# Altium project AT-kdFCU.PrjPcb
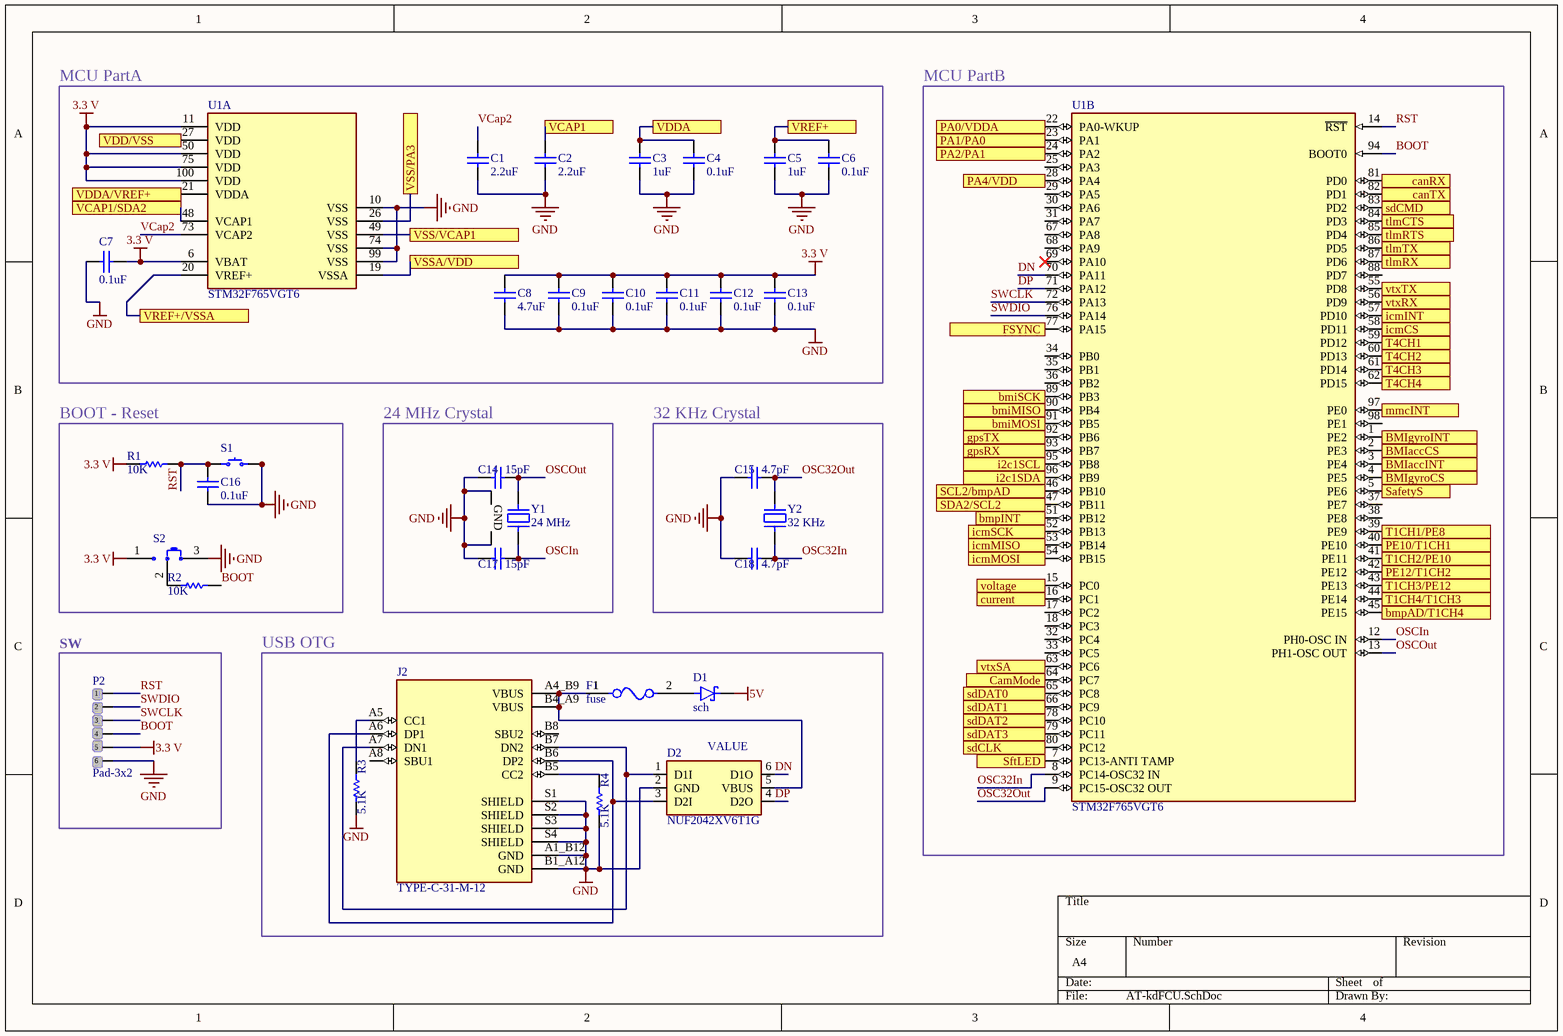
[diagram p0: AT-kdFCU.SchDoc]
3 sheets, 137 parts. Net scope: flat (ports and power ports of the same name join across sheets).
Board file: AT-kdFCU.PcbDoc
Sheets:
  AT-kdFCU.SchDoc
  AT-kdSENS.SchDoc
  AT-kdCONN.SchDoc

## Sheet AT-kdFCU.SchDoc
size A4; SheetNumber: 1; SheetTotal: 3

### Parts
C1  2.2uF  [Capacitor-0603]
C2  2.2uF  [Capacitor-0603]
C3  1uF  [Capacitor-0603]
C4  0.1uF  [Capacitor-0603]
C5  1uF  [Capacitor-0603]
C6  0.1uF  [Capacitor-0603]
C7  0.1uF  [Capacitor-0603]
C8  4.7uF  [Capacitor-0603]
C9  0.1uF  [Capacitor-0603]
C10  0.1uF  [Capacitor-0603]
C11  0.1uF  [Capacitor-0603]
C12  0.1uF  [Capacitor-0603]
C13  0.1uF  [Capacitor-0603]
C14  15pF  [Capacitor-0603]
C15  4.7pF  [Capacitor-0603]
C16  0.1uF  [Capacitor-0603]
C17  15pF  [Capacitor-0603]
C18  4.7pF  [Capacitor-0603]
D1  sch  [SODFL3619X98N]
D2  NUF2042XV6T1G  [SOT-563]
F1  fuse  [FP-MF-NSMF012-2-MFG]
J2  TYPE-C-31-M-12  [HRO_TYPE-C-31-M-12]
P2  Pad-3x2  [Pad-3x2]
R1  10K  [Resistor-0603]
R2  10K  [Resistor-0603]
R3  5.1K  [Resistor-0603]
R4  5.1K  [Resistor-0603]
S1  PTS810 SJM 250 SMTR LFS  [button]  (value not drawn)
S2  slideSwitch  [switch]  (value not drawn)
U1  STM32F765VGT6  [FP-LQFP100-1L-IPC_B]  (parts A,B of 2)
Y1  24 MHz  [XTAL_TSX-3225_25.0000MF10P-C3]
Y2  32 KHz  [XTAL_ABS07-32.768KHZ-7-T]

### Blocks framed on the sheet
MCU PartA: C1-C13 U1
MCU PartB: U1
BOOT - Reset: C16 R1 R2 S1 S2
24 MHz Crystal: C14 C17 Y1
32 KHz Crystal: C15 C18 Y2
SW: P2
USB OTG: D1 D2 F1 J2 R3 R4

### Ports
BMIaccCS (see AT-kdSENS[1A]), BMIaccINT (see AT-kdSENS[1A]), BMIgyroCS (see AT-kdSENS[1A]), BMIgyroINT (see AT-kdSENS[1A]), bmiMISO (see AT-kdSENS[2B]), bmiMOSI (see AT-kdSENS[1A]), bmiSCK (see AT-kdSENS[1A]), bmpAD/T1CH4 (see AT-kdCONN[2D]), bmpINT (see AT-kdSENS[4A]), CamMode (see AT-kdCONN[2C]), canRX (see AT-kdSENS[1C]), canTX (see AT-kdSENS[1B]), current (see AT-kdCONN[3A]), FSYNC (see AT-kdSENS[1A], AT-kdSENS[2A]), gpsRX (see AT-kdCONN[3C]), gpsTX (see AT-kdCONN[3C]), i2c1SCL (see AT-kdSENS[2C]), i2c1SDA (see AT-kdSENS[2D]), icmCS (see AT-kdSENS[2A]), icmINT (see AT-kdSENS[3A]), icmMISO (see AT-kdSENS[2A]), icmMOSI (see AT-kdSENS[2A]), icmSCK (see AT-kdSENS[2A]), mmcINT (see AT-kdSENS[3C]), PA0/VDDA (see AT-kdCONN[2C]), PA1/PA0 (see AT-kdCONN[2C]), PA2/PA1 (see AT-kdCONN[2C]), PA4/VDD (see AT-kdCONN[2C]), PE10/T1CH1 (see AT-kdCONN[2C]), PE12/T1CH2 (see AT-kdCONN[2D]), SafetyS (see AT-kdSENS[4B]), SCL2/bmpAD (see AT-kdCONN[2D]), SDA2/SCL2 (see AT-kdCONN[2D]), sdCLK (see AT-kdSENS[1D]), sdCMD (see AT-kdSENS[1D]), sdDAT0 (see AT-kdSENS[1D]), sdDAT1 (see AT-kdSENS[1D]), sdDAT2 (see AT-kdSENS[1D]), sdDAT3 (see AT-kdSENS[1D]), SftLED (see AT-kdSENS[4C]), T1CH1/PE8 (see AT-kdCONN[2C]), T1CH2/PE10 (see AT-kdCONN[2C]), T1CH3/PE12 (see AT-kdCONN[2D]), T1CH4/T1CH3 (see AT-kdCONN[2D]), T4CH1 (see AT-kdCONN[1A]), T4CH2 (see AT-kdCONN[1A]), T4CH3 (see AT-kdCONN[1A]), T4CH4 (see AT-kdCONN[1A]), tlmCTS (see AT-kdCONN[3C]), tlmRTS (see AT-kdCONN[3C]), tlmRX (see AT-kdCONN[3C]), tlmTX (see AT-kdCONN[3C]), VCAP1 (see AT-kdCONN[1D]), VCAP1/SDA2 (see AT-kdCONN[2D]), VDD/VSS (see AT-kdCONN[2C]), VDDA (see AT-kdCONN[1C]), VDDA/VREF+ (see AT-kdCONN[2B]), voltage (see AT-kdCONN[3A]), VREF+ (see AT-kdCONN[1C]), VREF+/VSSA (see AT-kdCONN[2B]), VSS/PA3 (see AT-kdCONN[2C]), VSS/VCAP1 (see AT-kdCONN[2D]), VSSA/VDD (see AT-kdCONN[2B]), vtxRX (see AT-kdCONN[4C]), vtxSA (see AT-kdCONN[4C]), vtxTX (see AT-kdCONN[4C])

### Nets
3.3 V: C7.2 C8.2 C9.2 C10.2 C11.2 C12.2 C13.2 P2.5 R1.1 S2.1 U1.6(VBAT) U1.11(VDD) U1.50(VDD) U1.75(VDD) U1.100(VDD)
5V: D1.K
GND: C1.1 C2.1 C3.1 C4.1 C5.1 C6.1 C7.1 C8.1 C9.1 C10.1 C11.1 C12.1 C13.1 C14.2 C15.2 C16.1 C17.2 C18.2 D2.2(GND) J2.A1_B12(GND) J2.B1_A12(GND) J2.S1(SHIELD) J2.S2(SHIELD) J2.S3(SHIELD) J2.S4(SHIELD) P2.6 R3.1 R4.1 S1.3 S1.4 S2.3 U1.10(VSS) U1.74(VSS) U1.99(VSS) Y1.2(GND) Y1.4(GND)
BOOT: P2.4 R2.2 U1.94(BOOT0)
DN: D2.6(D1O) U1.70(PA11)
DP: D2.4(D2O) U1.71(PA12)
OSC32In: C18.1 U1.8(PC14-OSC32_IN) Y2.1
OSC32Out: C15.1 U1.9(PC15-OSC32_OUT) Y2.2
OSCIn: C17.1 U1.12(PH0-OSC_IN) Y1.3
OSCOut: C14.1 U1.13(PH1-OSC_OUT) Y1.1
RST: C16.2 P2.1 R1.2 S1.1 S1.2 U1.14(~{RST})
SWCLK: P2.3 U1.72(PA13)
SWDIO: P2.2 U1.76(PA14)
VCap2: C1.2 U1.73(VCAP2)
NetC2_2: C2.2 ; port VCAP1
NetC3_2: C3.2 C4.2 ; port VDDA
NetC5_2: C5.2 C6.2 ; port VREF+
NetC31_1: U1.5(PE6) ; port SafetyS
NetC35_1: U1.15(PC0) ; port voltage
NetC36_1: U1.16(PC1) ; port current
NetD1_A: D1.A F1.2
NetD2_1: D2.1(D1I) J2.A7(DN1) J2.B7(DN2)
NetD2_3: D2.3(D2I) J2.A6(DP1) J2.B6(DP2)
NetD2_5: D2.5(VBUS) F1.1 J2.A4_B9(VBUS) J2.B4_A9(VBUS)
NetDS1_2: U1.7(PC13-ANTI_TAMP) ; port SftLED
NetJ2_A5: J2.A5(CC1) R3.2
NetJ2_B5: J2.B5(CC2) R4.2
NetJ3_1: U1.78(PC10) ; port sdDAT2
NetJ3_2: U1.79(PC11) ; port sdDAT3
NetJ3_3: U1.83(PD2) ; port sdCMD
NetJ3_7: U1.65(PC8) ; port sdDAT0
NetJ3_8: U1.66(PC9) ; port sdDAT1
NetJ6_3: U1.64(PC7) ; port CamMode
NetJ7_2: U1.24(PA2) ; port PA2/PA1
NetJ9_2: U1.86(PD5) ; port tlmTX
NetJ9_3: U1.87(PD6) ; port tlmRX
NetJ9_4: U1.84(PD3) ; port tlmCTS
NetJ9_5: U1.85(PD4) ; port tlmRTS
NetJ10_2: U1.92(PB6) ; port gpsTX
NetJ10_3: U1.93(PB7) ; port gpsRX
NetJ10_4: U1.95(PB8) ; port i2c1SCL
NetJ10_5: U1.96(PB9) ; port i2c1SDA
NetJ11_2: U1.56(PD9) ; port vtxRX
NetJ11_3: U1.55(PD8) ; port vtxTX
NetJ11_4: U1.63(PC6) ; port vtxSA
NetR2_1: R2.1 S2.2(COM)
NetR7_2: U1.90(PB4) ; port bmiMISO
NetR13_1: U1.82(PD1) ; port canTX
NetR15_1: U1.81(PD0) ; port canRX
NetR24_2: U1.80(PC12) ; port sdCLK
NetR29_2: U1.59(PD12) ; port T4CH1
NetR32_2: U1.60(PD13) ; port T4CH2
NetR33_2: U1.61(PD14) ; port T4CH3
NetR34_2: U1.62(PD15) ; port T4CH4
NetR39_2: U1.19(VSSA) ; port VSSA/VDD
NetR41_2: U1.20(VREF+) ; port VREF+/VSSA
NetR44_2: U1.21(VDDA) ; port VDDA/VREF+
NetR46_2: U1.22(PA0-WKUP) ; port PA0/VDDA
NetR48_2: U1.23(PA1) ; port PA1/PA0
NetR50_2: U1.26(VSS) ; port VSS/PA3
NetR51_2: U1.27(VDD) ; port VDD/VSS
NetR53_2: U1.28(PA4) ; port PA4/VDD
NetR55_2: U1.39(PE9) ; port T1CH1/PE8
NetR57_2: U1.40(PE10) ; port PE10/T1CH1
NetR58_2: U1.41(PE11) ; port T1CH2/PE10
NetR59_2: U1.42(PE12) ; port PE12/T1CH2
NetR60_2: U1.43(PE13) ; port T1CH3/PE12
NetR61_2: U1.44(PE14) ; port T1CH4/T1CH3
NetR63_2: U1.45(PE15) ; port bmpAD/T1CH4
NetR65_2: U1.46(PB10) ; port SCL2/bmpAD
NetR67_2: U1.47(PB11) ; port SDA2/SCL2
NetR69_2: U1.48(VCAP1) ; port VCAP1/SDA2
NetR71_2: U1.49(VSS) ; port VSS/VCAP1
NetU1_1: U1.1(PE2) ; port BMIgyroINT
NetU1_2: U1.2(PE3) ; port BMIaccCS
NetU1_3: U1.3(PE4) ; port BMIaccINT
NetU1_4: U1.4(PE5) ; port BMIgyroCS
NetU1_51: U1.51(PB12) ; port bmpINT
NetU1_52: U1.52(PB13) ; port icmSCK
NetU1_53: U1.53(PB14) ; port icmMISO
NetU1_54: U1.54(PB15) ; port icmMOSI
NetU1_57: U1.57(PD10) ; port icmINT
NetU1_58: U1.58(PD11) ; port icmCS
NetU1_77: U1.77(PA15) ; port FSYNC
NetU1_89: U1.89(PB3) ; port bmiSCK
NetU1_91: U1.91(PB5) ; port bmiMOSI
NetU1_97: U1.97(PE0) ; port mmcINT

Not connected (* = marked no-connect by the designer): J2 A8(SBU1) B8(SBU2); U1 17(PC2) 18(PC3) 25(PA3) 29(PA5) 30(PA6) 31(PA7) 32(PC4) 33(PC5) 34(PB0) 35(PB1) 36(PB2) 37(PE7) 38(PE8) 67(PA8) 68(PA9) 69(PA10)* 88(PD7) 98(PE1)

### Notes on the sheet
- (in symbol NUF2042XV6T1G) VALUE

### Library data of the parts
C1-C18 = 0603-Cap
D1 = MBR230LSFT1G: DIODE SCHOTTKY 30V 2A SOD123 MBR230LSTR; MF: ON Semiconductor; SnapEDA_Link: https://www.snapeda.com/parts/MBR230LSFT1G/Onsemi/view-part/?ref=snap; Package: SOD-123FL-2 ON Semiconductor; Value: *; MP: MBR230LSFT1G; Check_prices: https://www.snapeda.com/parts/MBR230LSFT1G/Onsemi/view-part/?ref=eda
D2 = NUF2042XV6T1G: RC (Pi) EMI Filter 2nd Order Low Pass 2 Channel R = 22Ohms, C = 42pF (Total) SOT-563, SOT-666; MF: onsemi; SnapEDA_Link: https://www.snapeda.com/parts/NUF2042XV6T1G/Onsemi/view-part/?ref=snap; Package: SOT-563-6 ON Semiconductor; MP: NUF2042XV6T1G; Check_prices: https://www.snapeda.com/parts/NUF2042XV6T1G/Onsemi/view-part/?ref=eda
F1 = CMP-07400-000025-1: PTC RESET FUSE 30V 120MA 1206; Manufacturer Part Number: MF-NSMF012-2; Manufacturer: Bourns Inc.; Hold Current: 0.12A; Trip Time: 0.2s; Trip Current: 0.29A; Automotive Grade: Grade 3; Resistance: 1.35-8.5Ω; Current Rating: 10A; Value: 1.35-8.5Ω; Category: Fuse; Device Class L2: PTC Resettable Fuses; ComponentLink2URL: https://www.bourns.com/docs/Product-Datasheets/mfnsmf.pdf; Package: MF-NSMF012-2; Automotive: Yes; Temperature Range Low: -40°C; Lead Free: Yes; Voltage Rating: 30V; Digikey Description: PTC RESET FUSE 30V 120MA 1206; Ambient Temperature Range Low: -40°C; Ambient Temperature Range High: +85°C; RoHS: TRUE; Device Class L3: unset; Device Class L1: Circuit Protection; Mouser Description: Resettable Fuses - PPTC 0.12A 30V 1.35ohm; Octopart: https://octopart.com/mf-nsmf012-2-bourns-24569; Temperature Range High: +85°C; ComponentLink2Description: Datasheet; Height: 1.1mm; Temperature: -40°C to +85°C
J2 = TYPE-C-31-M-12: USB Connectors 24 Receptacle 1 8.94*7.3mm RoHS; MF: HRO Electronics Co., Ltd.; Price: None; Value: *; SnapEDA_Link: https://www.snapeda.com/parts/TYPE-C-31-M-12/HRO+Electronics+Co.%252C+Ltd./view-part/?ref=snap; Package: Package; Availability: Not in stock; Check_prices: https://www.snapeda.com/parts/TYPE-C-31-M-12/HRO+Electronics+Co.%252C+Ltd./view-part/?ref=eda; MP: TYPE-C-31-M-12
R1-R4 = 0603-Res
S1 = PTS810 SJM 250 SMTR LFS: SWITCH TACTILE SPST-NO 0.05A 16V; Manufacturer: C&K; Actuator Height off PCB, Vertical: 2.50mm; Actuator Orientation: Top Actuated; Actuator Type: Oval Button; Contact Rating @ Voltage: 0.05A @ 16VDC; Illumination: Non-Illuminated; Operating Force: 160gf; Outline: 4.20mm x 3.20mm; Switch Function: Off-Mom; Part Number: PTS810 SJM 250 SMTR LFS; Circuit: SPST-NO; ComponentLink1Description: Datasheet; ComponentLink1URL: https://dznh3ojzb2azq.cloudfront.net/products/Tactile/PTS810/documents/datasheet.pdf; ComponentLink2Description: DigiKey Link; ComponentLink2URL: http://digikey.com/product-detail/en/c-k/PTS810-SJM-250-SMTR-LFS/CKN10502CT-ND/4176673; LastUpdated: 9/04/2020 10:00:13; Lifecycle Status: Active; Minimum Order: 1; Mounting Type: Surface Mount; Operating Temperature: -40°C ~ 85°C; Packaging: TapeAndReel; Part Status: Active; Price: 0.16; Series: PTS810; Supplier 1: DigiKey; Supplier Part Number 1: CKN10502CT-ND; Termination Style: J Lead
S2 = SS312SAH4-R: SWITCH SLIDE SPDT 0.4VA 28V; Part Number: SS312SAH4-R
U1 = CMP-12105-000145-1: IC MCU 32BIT 1MB FLASH 100LQFP; Peripherals: Brown-out Detect/Reset; Number of I/Os: 82; Interface: I2C; Oscillator Type: Internal; Frequency: 216MHz; Core Architecture: ARM; Memory Size: 1MB; Min Operating Temperature: -40°C; Packaging: Tray; Memory Type: FLASH; Max Operating Temperature: 85°C; Case/Package: LQFP; RoHS Compliant: Yes
Y1 = TSX-3225 24.0000MF15X-AC6: CRYSTAL 24.0000MHZ 9PF SMD; Manufacturer: EPSON; ESR (Equivalent Series Resistance): 40 Ohms; Frequency Stability: ±15ppm; Frequency Tolerance: ±10ppm; Operating Mode: Fundamental; Part Number: TSX-3225 24.0000MF15X-AC6; ComponentLink1Description: Datasheet; ComponentLink1URL: https://support.epson.biz/td/api/doc_check.php?dl=brief_TSX-3225&lang=en; ComponentLink2Description: DigiKey Link; ComponentLink2URL: https://www.digikey.com/en/products/detail/epson/TSX-3225-24-0000MF15X-AC6/5261221; Frequency: 24 MHz; Height - Seated (Max): 0.024" (0.60mm); LastUpdated: 3.06.2024 20:02:15; Lifecycle Status: Active; Load Capacitance: 9pF; Minimum Order: 1; Mounting Type: Surface Mount; Operating Temperature: -40°C ~ 85°C; Package / Case: 4-SMD, No Lead; Packaging: TapeAndReel; PartId: 432; Part Status: Active; Price: 0.20; Series: TSX-3225; Size / Dimension: 0.126" L x 0.098" W (3.20mm x 2.50mm); Supplier 1: DigiKey; Supplier Part Number 1: SER4180CT-ND; Type: MHz Crystal; Value: 24 MHz
Y2 = ABS07-32.768KHZ-7-T: CRYSTAL 32.7680KHZ 7PF SMD; Part Number: ABS07-32.768KHZ-7-T

## Sheet AT-kdSENS.SchDoc
size A4; SheetNumber: 2; SheetTotal: 3
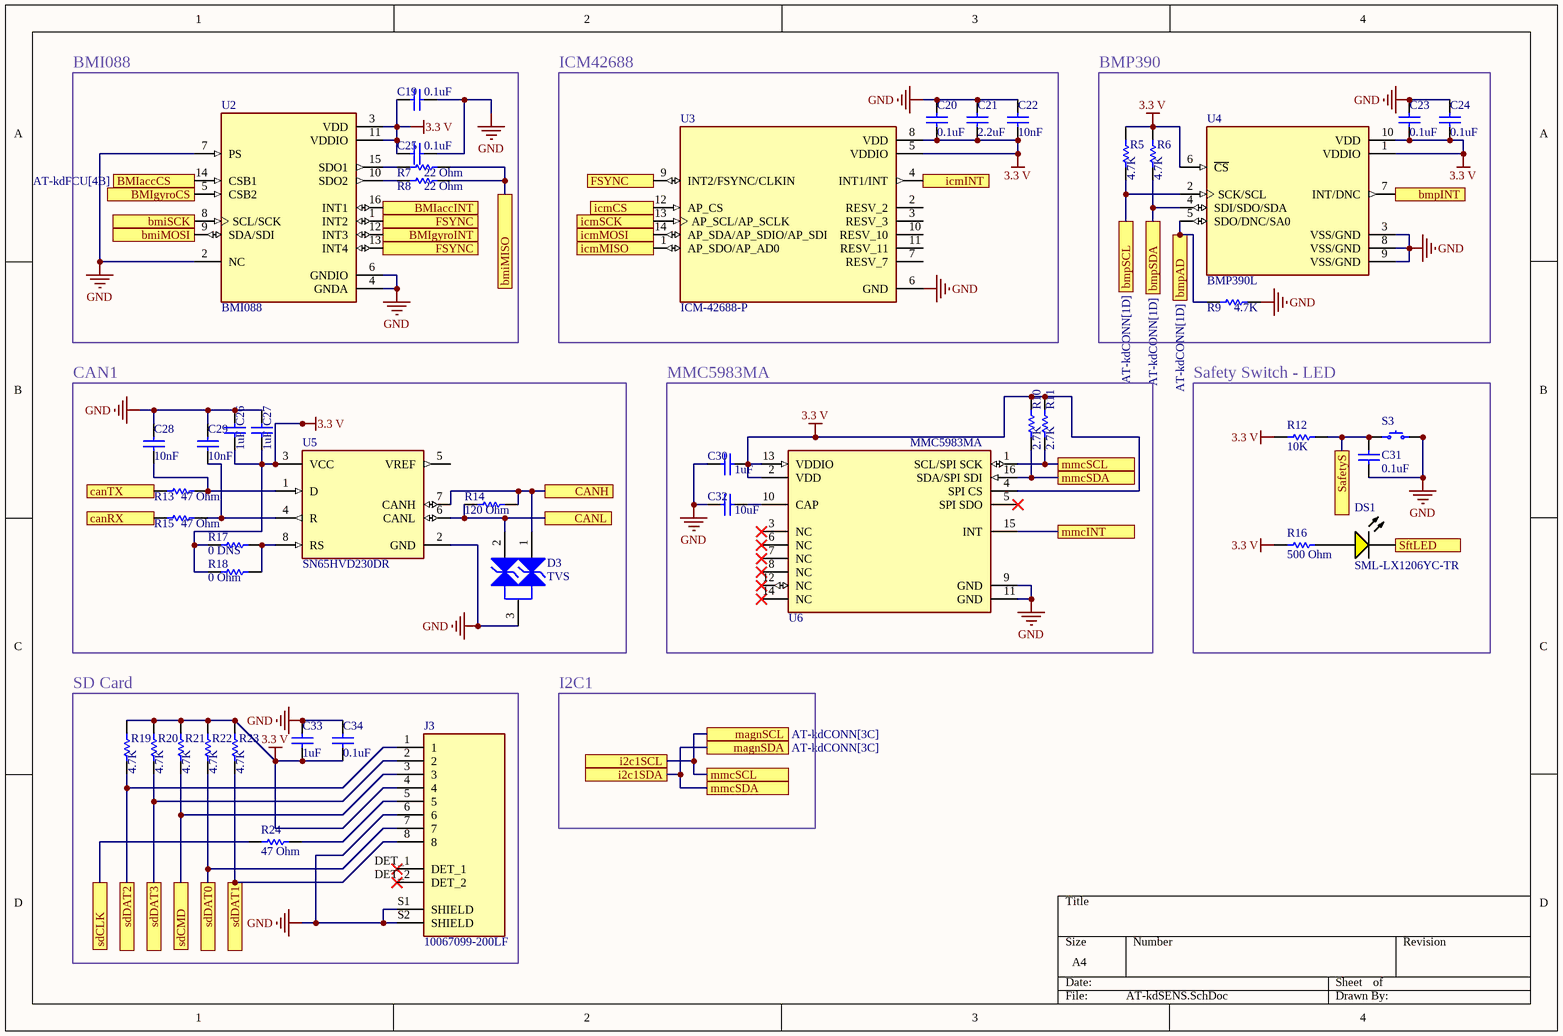
[diagram p1: AT-kdSENS.SchDoc]

### Parts
C19  0.1uF  [Capacitor-0603]
C20  0.1uF  [Capacitor-0603]
C21  2.2uF  [Capacitor-0603]
C22  10nF  [Capacitor-0603]
C23  0.1uF  [Capacitor-0603]
C24  0.1uF  [Capacitor-0603]
C25  0.1uF  [Capacitor-0603]
C26  1uF  [Capacitor-0603]
C27  1uF  [Capacitor-0603]
C28  10nF  [Capacitor-0603]
C29  10nF  [Capacitor-0603]
C30  1uF  [Capacitor-0603]
C31  0.1uF  [Capacitor-0603]
C32  10uF  [Capacitor-0603]
C33  1uF  [Capacitor-0603]
C34  0.1uF  [Capacitor-0603]
D3  TVS  [ONSC-SOT-23-3-318-08_V]
DS1  SML-LX1206YC-TR  [LUMX-SML-LX1206YC-TR_V]
J3  10067099-200LF  [AMPHENOL_10067099-200LF]
R5  4.7K  [Resistor-0603]
R6  4.7K  [Resistor-0603]
R7  22 Ohm  [Resistor-0603]
R8  22 Ohm  [Resistor-0603]
R9  4.7K  [Resistor-0603]
R10  2.7K  [Resistor-0603]
R11  2.7K  [Resistor-0603]
R12  10K  [Resistor-0603]
R13  47 Ohm  [Resistor-0603]
R14  120 Ohm  [Resistor-0603]
R15  47 Ohm  [Resistor-0603]
R16  500 Ohm  [Resistor-0603]
R17  0 DNS  [Resistor-0603]
R18  0 Ohm  [Resistor-0603]
R19  4.7K  [Resistor-0603]
R20  4.7K  [Resistor-0603]
R21  4.7K  [Resistor-0603]
R22  4.7K  [Resistor-0603]
R23  4.7K  [Resistor-0603]
R24  47 Ohm  [Resistor-0603]
S3  PTS810 SJM 250 SMTR LFS  [button]  (value not drawn)
U2  BMI088  [PQFN50P450X300X100-16N]
U3  ICM-42688-P  [PQFN50P300X250X97-14N]
U4  BMP390L  [XDCR_BMP390L]
U5  SN65HVD230DR  [FP-D0008A-IPC_A]
U6  MMC5983MA  [Memsic_0_MFG]

### Blocks framed on the sheet
BMI088: C19 C25 R7 R8 U2
ICM42688: C20-C22 U3
BMP390: C23 C24 R5 R6 R9 U4
CAN1: C26-C29 D3 R13-R15 R17 R18 U5
MMC5983MA: C30 C32 R10 R11 U6
Safety Switch - LED: C31 DS1 R12 R16 S3
SD Card: C33 C34 J3 R19-R24

### Ports
BMIaccCS (see AT-kdFCU[4B]), BMIaccINT (see AT-kdFCU[4B]), BMIgyroCS (see AT-kdFCU[4B]), BMIgyroINT (see AT-kdFCU[4B]), bmiMISO (see AT-kdFCU[3B]), bmiMOSI (see AT-kdFCU[3B]), bmiSCK (see AT-kdFCU[3B]), bmpAD (see AT-kdCONN[1D]), bmpINT (see AT-kdFCU[3C]), bmpSCL (see AT-kdCONN[1D]), bmpSDA (see AT-kdCONN[1D]), CANH (see AT-kdCONN[4C]), CANL (see AT-kdCONN[4C]), canRX (see AT-kdFCU[4A]), canTX (see AT-kdFCU[4A]), FSYNC (see AT-kdFCU[3B], AT-kdSENS[1A]), FSYNC (see AT-kdFCU[3B], AT-kdSENS[1A], AT-kdSENS[2A]), i2c1SCL (see AT-kdFCU[3B]), i2c1SDA (see AT-kdFCU[3B]), icmCS (see AT-kdFCU[4B]), icmINT (see AT-kdFCU[4B]), icmMISO (see AT-kdFCU[3C]), icmMOSI (see AT-kdFCU[3C]), icmSCK (see AT-kdFCU[3C]), magnSCL (see AT-kdCONN[3C]), magnSDA (see AT-kdCONN[3C]), mmcINT (see AT-kdFCU[4B]), mmcSCL (see AT-kdSENS[2D]), mmcSCL (see AT-kdSENS[3B]), mmcSDA (see AT-kdSENS[2D]), mmcSDA (see AT-kdSENS[3B]), SafetyS (see AT-kdFCU[4B]), sdCLK (see AT-kdFCU[3C]), sdCMD (see AT-kdFCU[4A]), sdDAT0 (see AT-kdFCU[3C]), sdDAT1 (see AT-kdFCU[3C]), sdDAT2 (see AT-kdFCU[3C]), sdDAT3 (see AT-kdFCU[3C]), SftLED (see AT-kdFCU[3C])

### Nets
3.3 V: C19.2 C20.2 C21.2 C22.2 C23.2 C24.2 C25.2 C26.1 C27.1 C30.2 C33.2 C34.2 J3.4 R5.2 R6.2 R10.2 R11.2 R12.2 R16.2 R17.1 R18.1 R19.2 R20.2 R21.2 R22.2 R23.2 U2.3(VDD) U2.11(VDDIO) U3.5(VDDIO) U3.8(VDD) U4.1(VDDIO) U4.6(~{CS}) U4.10(VDD) U5.3(VCC) U6.2(VDD) U6.4(SPI_CS) U6.13(VDDIO)
GND: C19.1 C20.1 C21.1 C22.1 C23.1 C24.1 C25.1 C26.2 C27.2 C28.1 C29.1 C30.1 C31.2 C32.1 C33.1 C34.1 D3.3(K) J3.6 J3.S1(SHIELD) J3.S2(SHIELD) R9.2 S3.3 S3.4 U2.2(NC) U2.4(GNDA) U2.6(GNDIO) U2.7(PS) U3.6(GND) U4.3(VSS/GND) U4.8(VSS/GND) U4.9(VSS/GND) U5.2(GND) U6.9(GND) U6.11(GND)
NetC28_2: C28.2 R13.2 U5.1(D)
NetC29_2: C29.2 R15.2 U5.4(R)
NetC31_1: C31.1 R12.1 S3.1 S3.2 ; port SafetyS
NetC32_2: C32.2 U6.10(CAP)
NetD3_1: D3.1(K) R14.2 U5.7(CANH) ; port CANH
NetD3_2: D3.2(K) R14.1 U5.6(CANL) ; port CANL
NetDS1_1: DS1.1(A) R16.1
NetDS1_2: DS1.2(K) ; port SftLED
NetJ3_1: J3.1 R19.1 ; port sdDAT2
NetJ3_2: J3.2 R20.1 ; port sdDAT3
NetJ3_3: J3.3 R21.1 ; port sdCMD
NetJ3_5: J3.5 R24.1
NetJ3_7: J3.7 R22.1 ; port sdDAT0
NetJ3_8: J3.8 R23.1 ; port sdDAT1
NetJ10_4: R11.1 U6.1(SCL/SPI_SCK) ; port mmcSCL, port i2c1SCL, port magnSCL
NetJ10_5: R10.1 U6.16(SDA/SPI_SDI) ; port mmcSDA, port i2c1SDA, port magnSDA
NetR5_1: R5.1 U4.2(SCK/SCL) ; port bmpSCL
NetR6_1: R6.1 U4.4(SDI/SDO/SDA) ; port bmpSDA
NetR7_1: R7.1 U2.15(SDO1)
NetR7_2: R7.2 R8.2 ; port bmiMISO
NetR8_1: R8.1 U2.10(SDO2)
NetR9_1: R9.1 U4.5(SDO/DNC/SA0) ; port bmpAD
NetR13_1: R13.1 ; port canTX
NetR15_1: R15.1 ; port canRX
NetR17_2: R17.2 R18.2 U5.8(RS)
NetR24_2: R24.2 ; port sdCLK
NetU1_1: U2.12(INT3) ; port BMIgyroINT
NetU1_2: U2.14(CSB1) ; port BMIaccCS
NetU1_3: U2.16(INT1) ; port BMIaccINT
NetU1_4: U2.5(CSB2) ; port BMIgyroCS
NetU1_51: U4.7(INT/DNC) ; port bmpINT
NetU1_52: U3.13(AP_SCL/AP_SCLK) ; port icmSCK
NetU1_53: U3.1(AP_SDO/AP_AD0) ; port icmMISO
NetU1_54: U3.14(AP_SDA/AP_SDIO/AP_SDI) ; port icmMOSI
NetU1_57: U3.4(INT1/INT) ; port icmINT
NetU1_58: U3.12(AP_CS) ; port icmCS
NetU1_77: U2.1(INT2) U2.13(INT4) U3.9(INT2/FSYNC/CLKIN) ; port FSYNC
NetU1_89: U2.8(SCL/SCK) ; port bmiSCK
NetU1_91: U2.9(SDA/SDI) ; port bmiMOSI
NetU1_97: U6.15(INT) ; port mmcINT

Not connected (* = marked no-connect by the designer): J3 DET_1* DET_2*; U3 2(RESV_2) 3(RESV_3) 7(RESV_7) 10(RESV_10) 11(RESV_11); U5 5(VREF); U6 3(NC)* 5(SPI_SDO)* 6(NC)* 7(NC)* 8(NC)* 12(NC)* 14(NC)*

### Notes on the sheet
- I2C1

### Library data of the parts
C19-C34 = 0603-Cap
D3 = CMP-1063-00164-1: Dual Line CAN Bus Protector, 3-Pin SOT-23, Pb-Free, Tape and Reel; PartNumber: NUP2105LT1G; Manufacturer: On Semiconductor; IR Max (uA): 0.1; Number of Lines: 2; Direction: Bidirectional; C Max (pF): 30; PPK Max (W): 350; V(BR) Min (V): 26.2; ComponentLink3URL: http://www.onsemi.cn/pub_link/Collateral/318-08.PDF; Mounting Technology: Surface Mount; ComponentLink2Description: Datasheet; ComponentLink1URL: http://www.onsemi.com/; PackageVersion: Rev. AP, 11/2009; DatasheetVersion: Rev. 5; RoHS: Pb-Free; PackageReference: SOT-23-3-318-08; ComponentLink2URL: http://www.onsemi.cn/pub_link/Collateral/NUP2105L-D.PDF; ComponentLink1Description: Manufacturer URL; PackageDescription: 3-Pin Small Outline Transistor, Body 2.92 x 1.3 mm, Pitch 0.95 mm; Packing: Tape and Reel; ComponentLink3Description: Package Specification
DS1 = CMP-2000-07124-1: Yellow LED, Water Clear Len, 585 nm, 2.1 V, -40 to 85 degC, 2-Pin SMD, RoHS, Tape and Reel; Manufacturer: Lumex; Product Training Modules: LEDsBenefitsofCustomLEDandLCDTechnology; Millicandela Rating: 6mcd; Catalog Drawings: SML-LX1206SeriesTopSML-LX1206SeriesSideSML-LX1206SeriesBottomSML-LX1206SeriesFootprint; Wavelength - Peak: 585nm; Other Names: 67-1358-2LU60357TRSMLLX1206YCTR; Lens Style/Size: RectanglewithFlatTop; Current - Test: 20mA; Lens Color: Colorless; Viewing Angle: 160°; Voltage - Forward (Vf) (Typ): 2.1V; Online Catalog: SML-LX1206RectanglewithFlatTop1206PackageLEDs; Mounting Type: SurfaceMount; Package Description: 2-Pin Surface Mount Device, Body 3.2 x 1.5 mm; Datasheet Version: Rev. K, 08/2012; Features: -; Color: Yellow; RoHS Information: RoHSCertofCompliance; Package Reference: SML-LX1206YC-TR; Supplier Device Package: 1206; Standard Package: 3,000; Series: -; Wavelength - Dominant: -; Package / Case: 1206(3216Metric); Mounting Technology: SurfaceMount; Height (Max): 1.10mm; Lens Transparency: Clear; Datasheet URL: http://www.lumex.com/content/files/ProductAttachment/SML-LX1206YC-TR.pdf; Family: LEDIndication-Discrete; Manufacturer URL: http://www.lumexinstruments.com/; Packaging: Tape&Reel(TR); Category: Optoelectronics; Size / Dimension: 3.20mmLx1.60mmW
J3 = 10067099-200LF: MF: {'manufacturer': u'Amphenol ICC (FCI)'}; Package: None; Price: None; Value: *; MP: 10067099-200LF; Availability: Unavailable
R5-R24 = 0603-Res
S3 = PTS810 SJM 250 SMTR LFS: as S1 on sheet AT-kdFCU; Part Number: PTS810 SJM 250 SMTR LFS; Circuit: SPST-NO; ComponentLink1Description: Datasheet; ComponentLink1URL: https://dznh3ojzb2azq.cloudfront.net/products/Tactile/PTS810/documents/datasheet.pdf; ComponentLink2Description: DigiKey Link; ComponentLink2URL: http://digikey.com/product-detail/en/c-k/PTS810-SJM-250-SMTR-LFS/CKN10502CT-ND/4176673; LastUpdated: 9/04/2020 10:00:13; Lifecycle Status: Active; Minimum Order: 1; Mounting Type: Surface Mount; Operating Temperature: -40°C ~ 85°C; Packaging: TapeAndReel; Part Status: Active; Price: 0.16; Series: PTS810; Supplier 1: DigiKey; Supplier Part Number 1: CKN10502CT-ND; Termination Style: J Lead
U2 = BMI088: High-performance 6-axis inertial sensor (accelerometer + gyroscope) <a href="https://pricing.snapeda.com/parts/BMI088/Bosch%20Sensortec/view-part?ref=eda">Check prices</a>; Package: None; MP: BMI088; Value: *; Availability: Unavailable; Price: None
U3 = ICM-42688-P: Accelerometer, Gyroscope, 6 Axis Sensor Output; Package: None; MP: ICM-42688-P; Value: *; Availability: Unavailable; Price: None
U4 = BMP390L: Pressure Sensor 4.35PSI ~ 18.13PSI (30kPa ~ 125kPa) Absolute - - 10-WFLGA; MF: Bosch Sensortec; SnapEDA_Link: https://www.snapeda.com/parts/BMP390L/Bosch+Sensortec/view-part/?ref=snap; Package: None; Value: *; MP: BMP390L; Check_prices: https://www.snapeda.com/parts/BMP390L/Bosch+Sensortec/view-part/?ref=eda
U5 = CMP-0315-00015-3: IC TRANSCEIVER HALF 1/1 8SOIC; Number of Transceivers: 1; Operating Supply Voltage: 3.3V; Number of I/Os: 2; Max Supply Current: 17mA; Max Supply Voltage: 3.6V; Min Supply Voltage: 3V; Data Rate: 1Mbps; Min Operating Temperature: -40°C; Packaging: Tape and Reel; Lead Free: Lead Free; Number of Transmit Buffers: 1; Max Operating Temperature: 85°C; Number of Receive Buffers: 1; Number of Pins: 8; Package Quantity: 1; Radiation Hardening: No; Case/Package: D; REACH SVHC: No SVHC; Weight: 0.002561oz; Termination: SMD/SMT; Contact Plating: Gold; Nominal Supply Current: 17mA; Number of Receivers: 1; Number of Drivers: 1

## Sheet AT-kdCONN.SchDoc
size A4; SheetNumber: 3; SheetTotal: 3
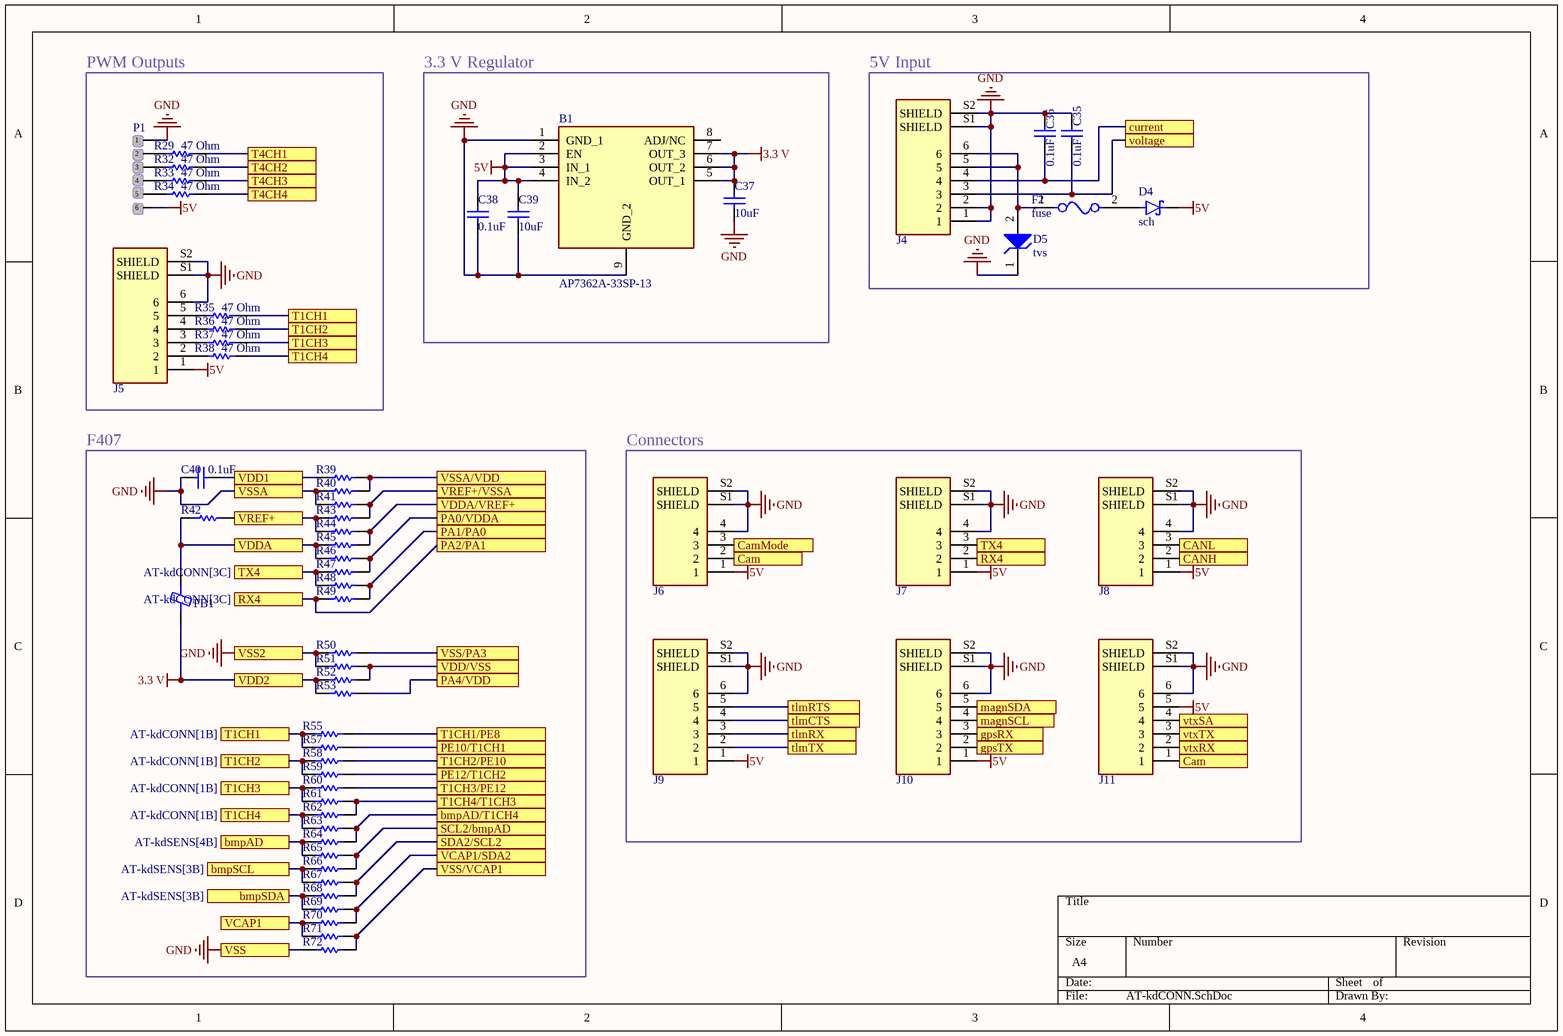
[diagram p2: AT-kdCONN.SchDoc]

### Parts
B1  AP7362A-33SP-13  [SOIC127P600X150-9N]
C35  0.1uF  [Capacitor-0603]
C36  0.1uF  [Capacitor-0603]
C37  10uF  [Capacitor-0603]
C38  0.1uF  [Capacitor-0603]
C39  10uF  [Capacitor-0603]
C40  0.1uF  [Capacitor-0603]
D4  sch  [SODFL3619X98N]
D5  tvs  [ONSC-SOD-123FL-2-498_V]
F2  fuse  [FP-MF-NSMF012-2-MFG]
FB1  100 Ohms @ 100 MHz  [BEADC1608X75N]  (value not drawn)
J4  BM06B-GHS-TBT(LF)(SN)(N)  [JST_BM06B-GHS-TBT(LF)(SN)(N)]  (value not drawn)
J5  BM06B-GHS-TBT(LF)(SN)(N)  [JST_BM06B-GHS-TBT(LF)(SN)(N)]  (value not drawn)
J6  BM04B-GHS-TBT(LF)(SN)(N)  [JST_BM04B-GHS-TBT(LF)(SN)(N)]  (value not drawn)
J7  BM04B-GHS-TBT(LF)(SN)(N)  [JST_BM04B-GHS-TBT(LF)(SN)(N)]  (value not drawn)
J8  BM04B-GHS-TBT(LF)(SN)(N)  [JST_BM04B-GHS-TBT(LF)(SN)(N)]  (value not drawn)
J9  BM06B-GHS-TBT(LF)(SN)(N)  [JST_BM06B-GHS-TBT(LF)(SN)(N)]  (value not drawn)
J10  BM06B-GHS-TBT(LF)(SN)(N)  [JST_BM06B-GHS-TBT(LF)(SN)(N)]  (value not drawn)
J11  BM06B-GHS-TBT(LF)(SN)(N)  [JST_BM06B-GHS-TBT(LF)(SN)(N)]  (value not drawn)
P1  Pad-6Pos  [Pad-6 Pos]  (value not drawn)
R29  47 Ohm  [Resistor-0603]
R32  47 Ohm  [Resistor-0603]
R33  47 Ohm  [Resistor-0603]
R34  47 Ohm  [Resistor-0603]
R35  47 Ohm  [Resistor-0603]
R36  47 Ohm  [Resistor-0603]
R37  47 Ohm  [Resistor-0603]
R38  47 Ohm  [Resistor-0603]
R39  CRCW02010000Z0ED  [RESC0603X28X15NL5T05]  (value not drawn)
R40  CRCW02010000Z0ED  [RESC0603X28X15NL5T05]  (value not drawn)
R41  CRCW02010000Z0ED  [RESC0603X28X15NL5T05]  (value not drawn)
R42  CRCW02010000Z0ED  [RESC0603X28X15NL5T05]  (value not drawn)
R43  CRCW02010000Z0ED  [RESC0603X28X15NL5T05]  (value not drawn)
R44  CRCW02010000Z0ED  [RESC0603X28X15NL5T05]  (value not drawn)
R45  CRCW02010000Z0ED  [RESC0603X28X15NL5T05]  (value not drawn)
R46  CRCW02010000Z0ED  [RESC0603X28X15NL5T05]  (value not drawn)
R47  CRCW02010000Z0ED  [RESC0603X28X15NL5T05]  (value not drawn)
R48  CRCW02010000Z0ED  [RESC0603X28X15NL5T05]  (value not drawn)
R49  CRCW02010000Z0ED  [RESC0603X28X15NL5T05]  (value not drawn)
R50  CRCW02010000Z0ED  [RESC0603X28X15NL5T05]  (value not drawn)
R51  CRCW02010000Z0ED  [RESC0603X28X15NL5T05]  (value not drawn)
R52  CRCW02010000Z0ED  [RESC0603X28X15NL5T05]  (value not drawn)
R53  CRCW02010000Z0ED  [RESC0603X28X15NL5T05]  (value not drawn)
R55  CRCW02010000Z0ED  [RESC0603X28X15NL5T05]  (value not drawn)
R57  CRCW02010000Z0ED  [RESC0603X28X15NL5T05]  (value not drawn)
R58  CRCW02010000Z0ED  [RESC0603X28X15NL5T05]  (value not drawn)
R59  CRCW02010000Z0ED  [RESC0603X28X15NL5T05]  (value not drawn)
R60  CRCW02010000Z0ED  [RESC0603X28X15NL5T05]  (value not drawn)
R61  CRCW02010000Z0ED  [RESC0603X28X15NL5T05]  (value not drawn)
R62  CRCW02010000Z0ED  [RESC0603X28X15NL5T05]  (value not drawn)
R63  CRCW02010000Z0ED  [RESC0603X28X15NL5T05]  (value not drawn)
R64  CRCW02010000Z0ED  [RESC0603X28X15NL5T05]  (value not drawn)
R65  CRCW02010000Z0ED  [RESC0603X28X15NL5T05]  (value not drawn)
R66  CRCW02010000Z0ED  [RESC0603X28X15NL5T05]  (value not drawn)
R67  CRCW02010000Z0ED  [RESC0603X28X15NL5T05]  (value not drawn)
R68  CRCW02010000Z0ED  [RESC0603X28X15NL5T05]  (value not drawn)
R69  CRCW02010000Z0ED  [RESC0603X28X15NL5T05]  (value not drawn)
R70  CRCW02010000Z0ED  [RESC0603X28X15NL5T05]  (value not drawn)
R71  CRCW02010000Z0ED  [RESC0603X28X15NL5T05]  (value not drawn)
R72  CRCW02010000Z0ED  [RESC0603X28X15NL5T05]  (value not drawn)

### Blocks framed on the sheet
PWM Outputs: J5 P1 R29 R32-R38
3.3 V Regulator: B1 C37-C39
5V Input: C35 C36 D4 D5 F2 J4
F407: C40 FB1 R39-R53 R55 R57-R72
Connectors: J6-J11

### Ports
bmpAD (see AT-kdSENS[4B]), bmpAD/T1CH4 (see AT-kdFCU[4C]), bmpSCL (see AT-kdSENS[3B]), bmpSDA (see AT-kdSENS[3B]), Cam (see AT-kdCONN[2C]), Cam (see AT-kdCONN[4C]), CamMode (see AT-kdFCU[3C]), CANH (see AT-kdSENS[2B]), CANL (see AT-kdSENS[2C]), current (see AT-kdFCU[3C]), gpsRX (see AT-kdFCU[3B]), gpsTX (see AT-kdFCU[3B]), magnSCL (see AT-kdSENS[2C]), magnSDA (see AT-kdSENS[2C]), PA0/VDDA (see AT-kdFCU[3A]), PA1/PA0 (see AT-kdFCU[3A]), PA2/PA1 (see AT-kdFCU[3A]), PA4/VDD (see AT-kdFCU[3A]), PE10/T1CH1 (see AT-kdFCU[4C]), PE12/T1CH2 (see AT-kdFCU[4C]), RX4 (see AT-kdCONN[1C]), RX4 (see AT-kdCONN[3C]), SCL2/bmpAD (see AT-kdFCU[3B]), SDA2/SCL2 (see AT-kdFCU[3B]), T1CH1 (see AT-kdCONN[1B]), T1CH1 (see AT-kdCONN[1C]), T1CH1/PE8 (see AT-kdFCU[4C]), T1CH2 (see AT-kdCONN[1B]), T1CH2 (see AT-kdCONN[1C]), T1CH2/PE10 (see AT-kdFCU[4C]), T1CH3 (see AT-kdCONN[1B]), T1CH3 (see AT-kdCONN[1D]), T1CH3/PE12 (see AT-kdFCU[4C]), T1CH4 (see AT-kdCONN[1B]), T1CH4 (see AT-kdCONN[1D]), T1CH4/T1CH3 (see AT-kdFCU[4C]), T4CH1 (see AT-kdFCU[4B]), T4CH2 (see AT-kdFCU[4B]), T4CH3 (see AT-kdFCU[4B]), T4CH4 (see AT-kdFCU[4B]), tlmCTS (see AT-kdFCU[4A]), tlmRTS (see AT-kdFCU[4A]), tlmRX (see AT-kdFCU[4B]), tlmTX (see AT-kdFCU[4A]), TX4 (see AT-kdCONN[1C]), TX4 (see AT-kdCONN[3C]), VCAP1 (see AT-kdFCU[2A]), VCAP1/SDA2 (see AT-kdFCU[1A]), VDD1, VDD2, VDD/VSS (see AT-kdFCU[1A]), VDDA (see AT-kdFCU[2A]), VDDA/VREF+ (see AT-kdFCU[1A]), voltage (see AT-kdFCU[3C]), VREF+ (see AT-kdFCU[3A]), VREF+/VSSA (see AT-kdFCU[1B]), VSS, VSS2, VSS/PA3 (see AT-kdFCU[2A]), VSS/VCAP1 (see AT-kdFCU[2A]), VSSA, VSSA/VDD (see AT-kdFCU[2B]), vtxRX (see AT-kdFCU[4B]), vtxSA (see AT-kdFCU[3C]), vtxTX (see AT-kdFCU[4B])

### Nets
3.3 V: B1.5(OUT_1) B1.6(OUT_2) B1.7(OUT_3) C37.1 FB1.1 R52.1 R53.1 ; port VDD2
5V: B1.2(EN) B1.3(IN_1) B1.4(IN_2) C38.1 C39.1 D4.K J5.1 J6.1 J7.1 J8.1 J9.1 J10.1 J11.5 P1.6
GND: B1.1(GND_1) B1.9(GND_2) C35.2 C36.2 C37.2 C38.2 C39.2 C40.1 D5.1(K) J4.1 J4.2 J4.S1(SHIELD) J4.S2(SHIELD) J5.6 J5.S1(SHIELD) J5.S2(SHIELD) J6.4 J6.S1(SHIELD) J6.S2(SHIELD) J7.4 J7.S1(SHIELD) J7.S2(SHIELD) J8.4 J8.S1(SHIELD) J8.S2(SHIELD) J9.6 J9.S1(SHIELD) J9.S2(SHIELD) J10.6 J10.S1(SHIELD) J10.S2(SHIELD) J11.6 J11.S1(SHIELD) J11.S2(SHIELD) P1.1 R40.1 R41.1 R50.1 R51.1 R72.1 ; port VSSA, port VSS2, port VSS
NetC2_2: R70.1 R71.1 ; port VCAP1
NetC3_2: FB1.2 R42.1 R45.1 R46.1 ; port VDDA
NetC5_2: R42.2 R43.1 R44.1 ; port VREF+
NetC35_1: C35.1 J4.3 ; port voltage
NetC36_1: C36.1 J4.4 ; port current
NetC40_2: C40.2 R39.1 ; port VDD1
NetD3_1: J8.2 ; port CANH
NetD3_2: J8.3 ; port CANL
NetD4_A: D4.A F2.2
NetD5_2: D5.2(A) F2.1 J4.5 J4.6
NetJ5_2: J5.2 R38.1
NetJ5_3: J5.3 R37.1
NetJ5_4: J5.4 R36.1
NetJ5_5: J5.5 R35.1
NetJ6_2: J6.2 J11.1 ; port Cam
NetJ6_3: J6.3 ; port CamMode
NetJ7_2: J7.2 R49.1 ; port PA2/PA1, port RX4
NetJ7_3: J7.3 R47.1 R48.1 ; port TX4
NetJ9_2: J9.2 ; port tlmTX
NetJ9_3: J9.3 ; port tlmRX
NetJ9_4: J9.4 ; port tlmCTS
NetJ9_5: J9.5 ; port tlmRTS
NetJ10_2: J10.2 ; port gpsTX
NetJ10_3: J10.3 ; port gpsRX
NetJ10_4: J10.4 ; port magnSCL
NetJ10_5: J10.5 ; port magnSDA
NetJ11_2: J11.2 ; port vtxRX
NetJ11_3: J11.3 ; port vtxTX
NetJ11_4: J11.4 ; port vtxSA
NetP1_2: P1.2 R29.1
NetP1_3: P1.3 R32.1
NetP1_4: P1.4 R33.1
NetP1_5: P1.5 R34.1
NetR5_1: R66.1 R67.1 ; port bmpSCL
NetR6_1: R68.1 R69.1 ; port bmpSDA
NetR9_1: R64.1 R65.1 ; port bmpAD
NetR29_2: R29.2 ; port T4CH1
NetR32_2: R32.2 ; port T4CH2
NetR33_2: R33.2 ; port T4CH3
NetR34_2: R34.2 ; port T4CH4
NetR35_2: R35.2 R55.1 R57.1 ; port T1CH1
NetR36_2: R36.2 R58.1 R59.1 ; port T1CH2
NetR37_2: R37.2 R60.1 R61.1 ; port T1CH3
NetR38_2: R38.2 R62.1 R63.1 ; port T1CH4
NetR39_2: R39.2 R40.2 ; port VSSA/VDD
NetR41_2: R41.2 R43.2 ; port VREF+/VSSA
NetR44_2: R44.2 R45.2 ; port VDDA/VREF+
NetR46_2: R46.2 R47.2 ; port PA0/VDDA
NetR48_2: R48.2 R49.2 ; port PA1/PA0
NetR50_2: R50.2 ; port VSS/PA3
NetR51_2: R51.2 R52.2 ; port VDD/VSS
NetR53_2: R53.2 ; port PA4/VDD
NetR55_2: R55.2 ; port T1CH1/PE8
NetR57_2: R57.2 ; port PE10/T1CH1
NetR58_2: R58.2 ; port T1CH2/PE10
NetR59_2: R59.2 ; port PE12/T1CH2
NetR60_2: R60.2 ; port T1CH3/PE12
NetR61_2: R61.2 R62.2 ; port T1CH4/T1CH3
NetR63_2: R63.2 R64.2 ; port bmpAD/T1CH4
NetR65_2: R65.2 R66.2 ; port SCL2/bmpAD
NetR67_2: R67.2 R68.2 ; port SDA2/SCL2
NetR69_2: R69.2 R70.2 ; port VCAP1/SDA2
NetR71_2: R71.2 R72.2 ; port VSS/VCAP1

Not connected (* = marked no-connect by the designer): B1 8(ADJ/NC)

### Library data of the parts
B1 = AP7362A-33SP-13: LDO Voltage Regulators LDO CMOS HiCurr SO-8 1.5A LowQ Adj 190mV; Manufacturer_Name: Diodes Incorporated; Geometry.Height: 1.5mm; Manufacturer_Part_Number: AP7362A-33SP-13; Mouser Part Number: 621-AP7362A-33SP-13; Mouser Price/Stock: https://www.mouser.co.uk/ProductDetail/Diodes-Incorporated/AP7362A-33SP-13?qs=M%2FOdCRO8QQ3CiX1oDLy5Bg%3D%3D; Arrow Part Number: AP7362A-33SP-13; Arrow Price/Stock: https://www.arrow.com/en/products/ap7362a-33sp-13/diodes-incorporated?utm_currency=USD&region=nac; Datasheet Link: https://www.diodes.com/assets/Datasheets/AP7362.pdf
C35-C40 = 0603-Cap
D4 = MBR230LSFT1G: as D1 on sheet AT-kdFCU; SnapEDA_Link: https://www.snapeda.com/parts/MBR230LSFT1G/Onsemi/view-part/?ref=snap; Package: SOD-123FL-2 ON Semiconductor; Value: *; MP: MBR230LSFT1G; Check_prices: https://www.snapeda.com/parts/MBR230LSFT1G/Onsemi/view-part/?ref=eda
D5 = CMP-1061-00612-1: 200 W Transient Voltage Suppressor, 2-Pin SOD-123FL, Pb-Free, Tape and Reel; PartNumber: SMF5.0AT1G; Manufacturer: On Semiconductor; Direction: Unidirectional; IR Max (uA): 400; V(BR) Typ (V): 6.7; PackageDescription: 2-Pin SOD, Body 1.65 x 2.7 mm; ComponentLink3Description: Package Specification; ComponentLink3URL: http://www.onsemi.com/pub_link/Collateral/498-01.PDF; PackageVersion: Rev. D, 05/2013; Mounting Technology: Surface Mount; PackageReference: SOD-123FL-2-498; ComponentLink2URL: http://www.onsemi.com/pub_link/Collateral/SMF5.0AT1-D.PDF; DatasheetVersion: Rev. 7; ComponentLink1Description: Manufacturer URL; Packing: Tape and Reel; RoHS: Pb-Free; ComponentLink1URL: http://www.onsemi.com/; ComponentLink2Description: Datasheet
F2 = CMP-07400-000025-1: as F1 on sheet AT-kdFCU; Category: Fuse; Device Class L2: PTC Resettable Fuses; ComponentLink2URL: https://www.bourns.com/docs/Product-Datasheets/mfnsmf.pdf; Package: MF-NSMF012-2; Automotive: Yes; Temperature Range Low: -40°C; Lead Free: Yes; Voltage Rating: 30V; Digikey Description: PTC RESET FUSE 30V 120MA 1206; Ambient Temperature Range Low: -40°C; Ambient Temperature Range High: +85°C; RoHS: TRUE; Device Class L3: unset; Device Class L1: Circuit Protection; Mouser Description: Resettable Fuses - PPTC 0.12A 30V 1.35ohm; Octopart: https://octopart.com/mf-nsmf012-2-bourns-24569; Temperature Range High: +85°C; ComponentLink2Description: Datasheet; Height: 1.1mm; Temperature: -40°C to +85°C
FB1 = MPZ1608D101BTA00: Ferrite Beads Multi-Layer High Current 600Ohm 25% 100MHz 2.3A 0.06Ohm DCR 0805 Automotive T/R; Manufacturer: TDK Corporation; Manufacturer Part Number: BLM21SP601SH1D; Current Rating (Max): 1A; DC Resistance (DCR) (Max): 150mOhm; Filter Type: Power Line; Number of Lines: 1; Current Rating: 1.5A; DC Resistance (DCR): 60mΩ; Impedance: 600Ω; Part Number: MPZ1608D101BTA00; ComponentLink1Description: Datasheet; ComponentLink1URL: https://product.tdk.com/info/en/catalog/datasheets/beads_commercial_power_mpz1608_en.pdf?ref_disty=digikey; ComponentLink2Description: DigiKey Link; ComponentLink2URL: https://www.digikey.com/en/products/detail/tdk-corporation/MPZ1608D101BTA00/1084520; Device Package: 0603 (1608 Metric); Height (Max): 0.037" (0.95mm); Impedance @ Frequency: 100 Ohms @ 100 MHz; LastUpdated: 3/06/2024 19:51:52; Lifecycle Status: Active; Minimum Order: 1; Mounting Type: Surface Mount; Operating Temperature: -55°C ~ 125°C; Package / Case: 0603 (1608 Metric); Packaging: TapeAndReel; PartId: 843; Part Status: Active; Price: 0.02; Series: MPZ; Size / Dimension: 0.063" L x 0.032" W (1.60mm x 0.80mm); Supplier 1: DigiKey; Supplier Part Number 1: 445-MPZ1608D101BTA00CT-ND; Value: 100 Ohms @ 100 MHz; Supplier: Farnell; Supplier Part Number: 3227839; RoHS: Compliant; Category: Ferrite Beads and Chips; Stock: 12289; Pricing: 10=0,218, 100=0,151, 500=0,108, 1000=0,0961, 2000=0,0879, 4000=0,0797 (EUR); Case/Package: 0805; Core Material: Ferrite; Height: 850µm; Length: 2mm; Max Operating Temperature: 125°C; Min Operating Temperature: -55°C; Number of Circuits: 1; Number of Terminals: 2; REACH SVHC: Yes; RMS Current (Irms): 2.3A; Schedule B: 8504500000, 8543706000, 8543706000|8543706000, 8543706000|8543706000|8543706000; ESR: 60mΩ; Test Frequency: 100MHz; Tolerance: 25%; Width: 1.25mm; ComponentLink3URL: https://datasheet.octopart.com:443/BLM21SP601SH1D-Murata-datasheet-180807142.pdf?src-supplier=IHS; ComponentLink3Description: https://datasheet.octopart.com:443/BLM21SP601SH1D-Murata-datasheet-180807142.pdf?src-supplier=IHS; ComponentLink4URL: https://datasheet.octopart.com:443/BLM21SP601SH1D-Murata-datasheet-138707483.pdf?src-supplier=ODG+(Origin+Data+Global); ComponentLink4Description: https://datasheet.octopart.com:443/BLM21SP601SH1D-Murata-datasheet-138707483.pdf?src-supplier=ODG+(Origin+Data+Global); ComponentLink5URL: https://datasheet.octopart.com:443/BLM21SP601SH1D-Murata-datasheet-166171483.pdf?src-supplier=TME; ComponentLink5Description: https://datasheet.octopart.com:443/BLM21SP601SH1D-Murata-datasheet-166171483.pdf?src-supplier=TME; ComponentLink6URL: http://sigma.octopart.com:80/reach_statement/Murata-company-16.pdf?src-supplier=Compliance+Statements; ComponentLink6Description: http://sigma.octopart.com:80/reach_statement/Murata-company-16.pdf?src-supplier=Compliance+Statements
J4 J5 J9-J11 = BM06B-GHS-TBT(LF)(SN)(N): Connector Header Surface Mount 6 position 0.049 (1.25mm); MF: JST Sales; SnapEDA_Link: https://www.snapeda.com/parts/BM06B-GHS-TBT(LF)(SN)(N)/JST/view-part/?ref=snap; Package: None; Value: *; MP: BM06B-GHS-TBT(LF)(SN)(N); Check_prices: https://www.snapeda.com/parts/BM06B-GHS-TBT(LF)(SN)(N)/JST/view-part/?ref=eda
J6-J8 = BM04B-GHS-TBT(LF)(SN)(N): Conn Shrouded Header HDR 4 POS 1.25mm Solder ST Top Entry SMD T/R; MF: JST; SnapEDA_Link: https://www.snapeda.com/parts/BM04B-GHS-TBT%20(LF)(SN)(N)/JST/view-part/?ref=snap; Package: None; Value: *; MP: BM04B-GHS-TBT (LF)(SN)(N); Check_prices: https://www.snapeda.com/parts/BM04B-GHS-TBT%20(LF)(SN)(N)/JST/view-part/?ref=eda
R29 R32-R38 = 0603-Res
R39-R53 R55 R57-R72 = CMP-2004-00001-2: Chip Resistor, 0 Ohm, Jumper, 0.05 W, -55 to 155 degC, 0201 (0603 Metric), RoHS, Tape and Reel; Voltage Rating: 30 V; Case\Package: 0201; Resistance: 0 mohm; Tolerance: 5%; Power Rating: 50 mW; REACH SVHC: Unknown; Length: 0.6 mm; Packaging: Cut Tape; Weight: 6E-06 oz; ComponentLink2URL: http://www.vishay.com/docs/20052/crcw0201e3.pdf; Mounting Technology: Surface Mount; Case Code (Imperial): 0201; Radiation Hardening: No; RoHSCompliant: true; Package Quantity: 1; Min Operating Temperature: -55 degC; Height: 0.23 mm; PackageReference: 0201; ComponentLink1Description: Manufacturer URL; ComponentLink2Description: Datasheet; Case Code (Metric): 0603; DatasheetVersion: 03/2016; Width: 0.3 mm; Mount: Surface Mount; PackageDescription: 2-Pin Surface Mount Device, Body 0.6 x 0.3 mm; ComponentLink1URL: http://www.vishay.com/; Max Operating Temperature: 155 degC

## Nets that join several sheets
3.3 V: AT-kdFCU (15 pins), AT-kdSENS (37 pins), AT-kdCONN (7 pins)
5V: AT-kdFCU (D1.K), AT-kdCONN (14 pins)
GND: AT-kdFCU (36 pins), AT-kdSENS (34 pins), AT-kdCONN (40 pins)
NetC2_2: AT-kdFCU (C2.2), AT-kdCONN (R70.1 R71.1)
NetC3_2: AT-kdFCU (C3.2 C4.2), AT-kdCONN (FB1.2 R42.1 R45.1 R46.1)
NetC5_2: AT-kdFCU (C5.2 C6.2), AT-kdCONN (R42.2 R43.1 R44.1)
NetC31_1: AT-kdFCU (U1.5), AT-kdSENS (C31.1 R12.1 S3.1 S3.2)
NetC35_1: AT-kdFCU (U1.15), AT-kdCONN (C35.1 J4.3)
NetC36_1: AT-kdFCU (U1.16), AT-kdCONN (C36.1 J4.4)
NetD3_1: AT-kdSENS (D3.1 R14.2 U5.7), AT-kdCONN (J8.2)
NetD3_2: AT-kdSENS (D3.2 R14.1 U5.6), AT-kdCONN (J8.3)
NetDS1_2: AT-kdFCU (U1.7), AT-kdSENS (DS1.2)
NetJ3_1: AT-kdFCU (U1.78), AT-kdSENS (J3.1 R19.1)
NetJ3_2: AT-kdFCU (U1.79), AT-kdSENS (J3.2 R20.1)
NetJ3_3: AT-kdFCU (U1.83), AT-kdSENS (J3.3 R21.1)
NetJ3_7: AT-kdFCU (U1.65), AT-kdSENS (J3.7 R22.1)
NetJ3_8: AT-kdFCU (U1.66), AT-kdSENS (J3.8 R23.1)
NetJ6_3: AT-kdFCU (U1.64), AT-kdCONN (J6.3)
NetJ7_2: AT-kdFCU (U1.24), AT-kdCONN (J7.2 R49.1)
NetJ9_2: AT-kdFCU (U1.86), AT-kdCONN (J9.2)
NetJ9_3: AT-kdFCU (U1.87), AT-kdCONN (J9.3)
NetJ9_4: AT-kdFCU (U1.84), AT-kdCONN (J9.4)
NetJ9_5: AT-kdFCU (U1.85), AT-kdCONN (J9.5)
NetJ10_2: AT-kdFCU (U1.92), AT-kdCONN (J10.2)
NetJ10_3: AT-kdFCU (U1.93), AT-kdCONN (J10.3)
NetJ10_4: AT-kdFCU (U1.95), AT-kdSENS (R11.1 U6.1), AT-kdCONN (J10.4)
NetJ10_5: AT-kdFCU (U1.96), AT-kdSENS (R10.1 U6.16), AT-kdCONN (J10.5)
NetJ11_2: AT-kdFCU (U1.56), AT-kdCONN (J11.2)
NetJ11_3: AT-kdFCU (U1.55), AT-kdCONN (J11.3)
NetJ11_4: AT-kdFCU (U1.63), AT-kdCONN (J11.4)
NetR5_1: AT-kdSENS (R5.1 U4.2), AT-kdCONN (R66.1 R67.1)
NetR6_1: AT-kdSENS (R6.1 U4.4), AT-kdCONN (R68.1 R69.1)
NetR7_2: AT-kdFCU (U1.90), AT-kdSENS (R7.2 R8.2)
NetR9_1: AT-kdSENS (R9.1 U4.5), AT-kdCONN (R64.1 R65.1)
NetR13_1: AT-kdFCU (U1.82), AT-kdSENS (R13.1)
NetR15_1: AT-kdFCU (U1.81), AT-kdSENS (R15.1)
NetR24_2: AT-kdFCU (U1.80), AT-kdSENS (R24.2)
NetR29_2: AT-kdFCU (U1.59), AT-kdCONN (R29.2)
NetR32_2: AT-kdFCU (U1.60), AT-kdCONN (R32.2)
NetR33_2: AT-kdFCU (U1.61), AT-kdCONN (R33.2)
NetR34_2: AT-kdFCU (U1.62), AT-kdCONN (R34.2)
NetR39_2: AT-kdFCU (U1.19), AT-kdCONN (R39.2 R40.2)
NetR41_2: AT-kdFCU (U1.20), AT-kdCONN (R41.2 R43.2)
NetR44_2: AT-kdFCU (U1.21), AT-kdCONN (R44.2 R45.2)
NetR46_2: AT-kdFCU (U1.22), AT-kdCONN (R46.2 R47.2)
NetR48_2: AT-kdFCU (U1.23), AT-kdCONN (R48.2 R49.2)
NetR50_2: AT-kdFCU (U1.26), AT-kdCONN (R50.2)
NetR51_2: AT-kdFCU (U1.27), AT-kdCONN (R51.2 R52.2)
NetR53_2: AT-kdFCU (U1.28), AT-kdCONN (R53.2)
NetR55_2: AT-kdFCU (U1.39), AT-kdCONN (R55.2)
NetR57_2: AT-kdFCU (U1.40), AT-kdCONN (R57.2)
NetR58_2: AT-kdFCU (U1.41), AT-kdCONN (R58.2)
NetR59_2: AT-kdFCU (U1.42), AT-kdCONN (R59.2)
NetR60_2: AT-kdFCU (U1.43), AT-kdCONN (R60.2)
NetR61_2: AT-kdFCU (U1.44), AT-kdCONN (R61.2 R62.2)
NetR63_2: AT-kdFCU (U1.45), AT-kdCONN (R63.2 R64.2)
NetR65_2: AT-kdFCU (U1.46), AT-kdCONN (R65.2 R66.2)
NetR67_2: AT-kdFCU (U1.47), AT-kdCONN (R67.2 R68.2)
NetR69_2: AT-kdFCU (U1.48), AT-kdCONN (R69.2 R70.2)
NetR71_2: AT-kdFCU (U1.49), AT-kdCONN (R71.2 R72.2)
NetU1_1: AT-kdFCU (U1.1), AT-kdSENS (U2.12)
NetU1_2: AT-kdFCU (U1.2), AT-kdSENS (U2.14)
NetU1_3: AT-kdFCU (U1.3), AT-kdSENS (U2.16)
NetU1_4: AT-kdFCU (U1.4), AT-kdSENS (U2.5)
NetU1_51: AT-kdFCU (U1.51), AT-kdSENS (U4.7)
NetU1_52: AT-kdFCU (U1.52), AT-kdSENS (U3.13)
NetU1_53: AT-kdFCU (U1.53), AT-kdSENS (U3.1)
NetU1_54: AT-kdFCU (U1.54), AT-kdSENS (U3.14)
NetU1_57: AT-kdFCU (U1.57), AT-kdSENS (U3.4)
NetU1_58: AT-kdFCU (U1.58), AT-kdSENS (U3.12)
NetU1_77: AT-kdFCU (U1.77), AT-kdSENS (U2.1 U2.13 U3.9)
NetU1_89: AT-kdFCU (U1.89), AT-kdSENS (U2.8)
NetU1_91: AT-kdFCU (U1.91), AT-kdSENS (U2.9)
NetU1_97: AT-kdFCU (U1.97), AT-kdSENS (U6.15)